# Altium project SN74LVC2T45.PrjPcb
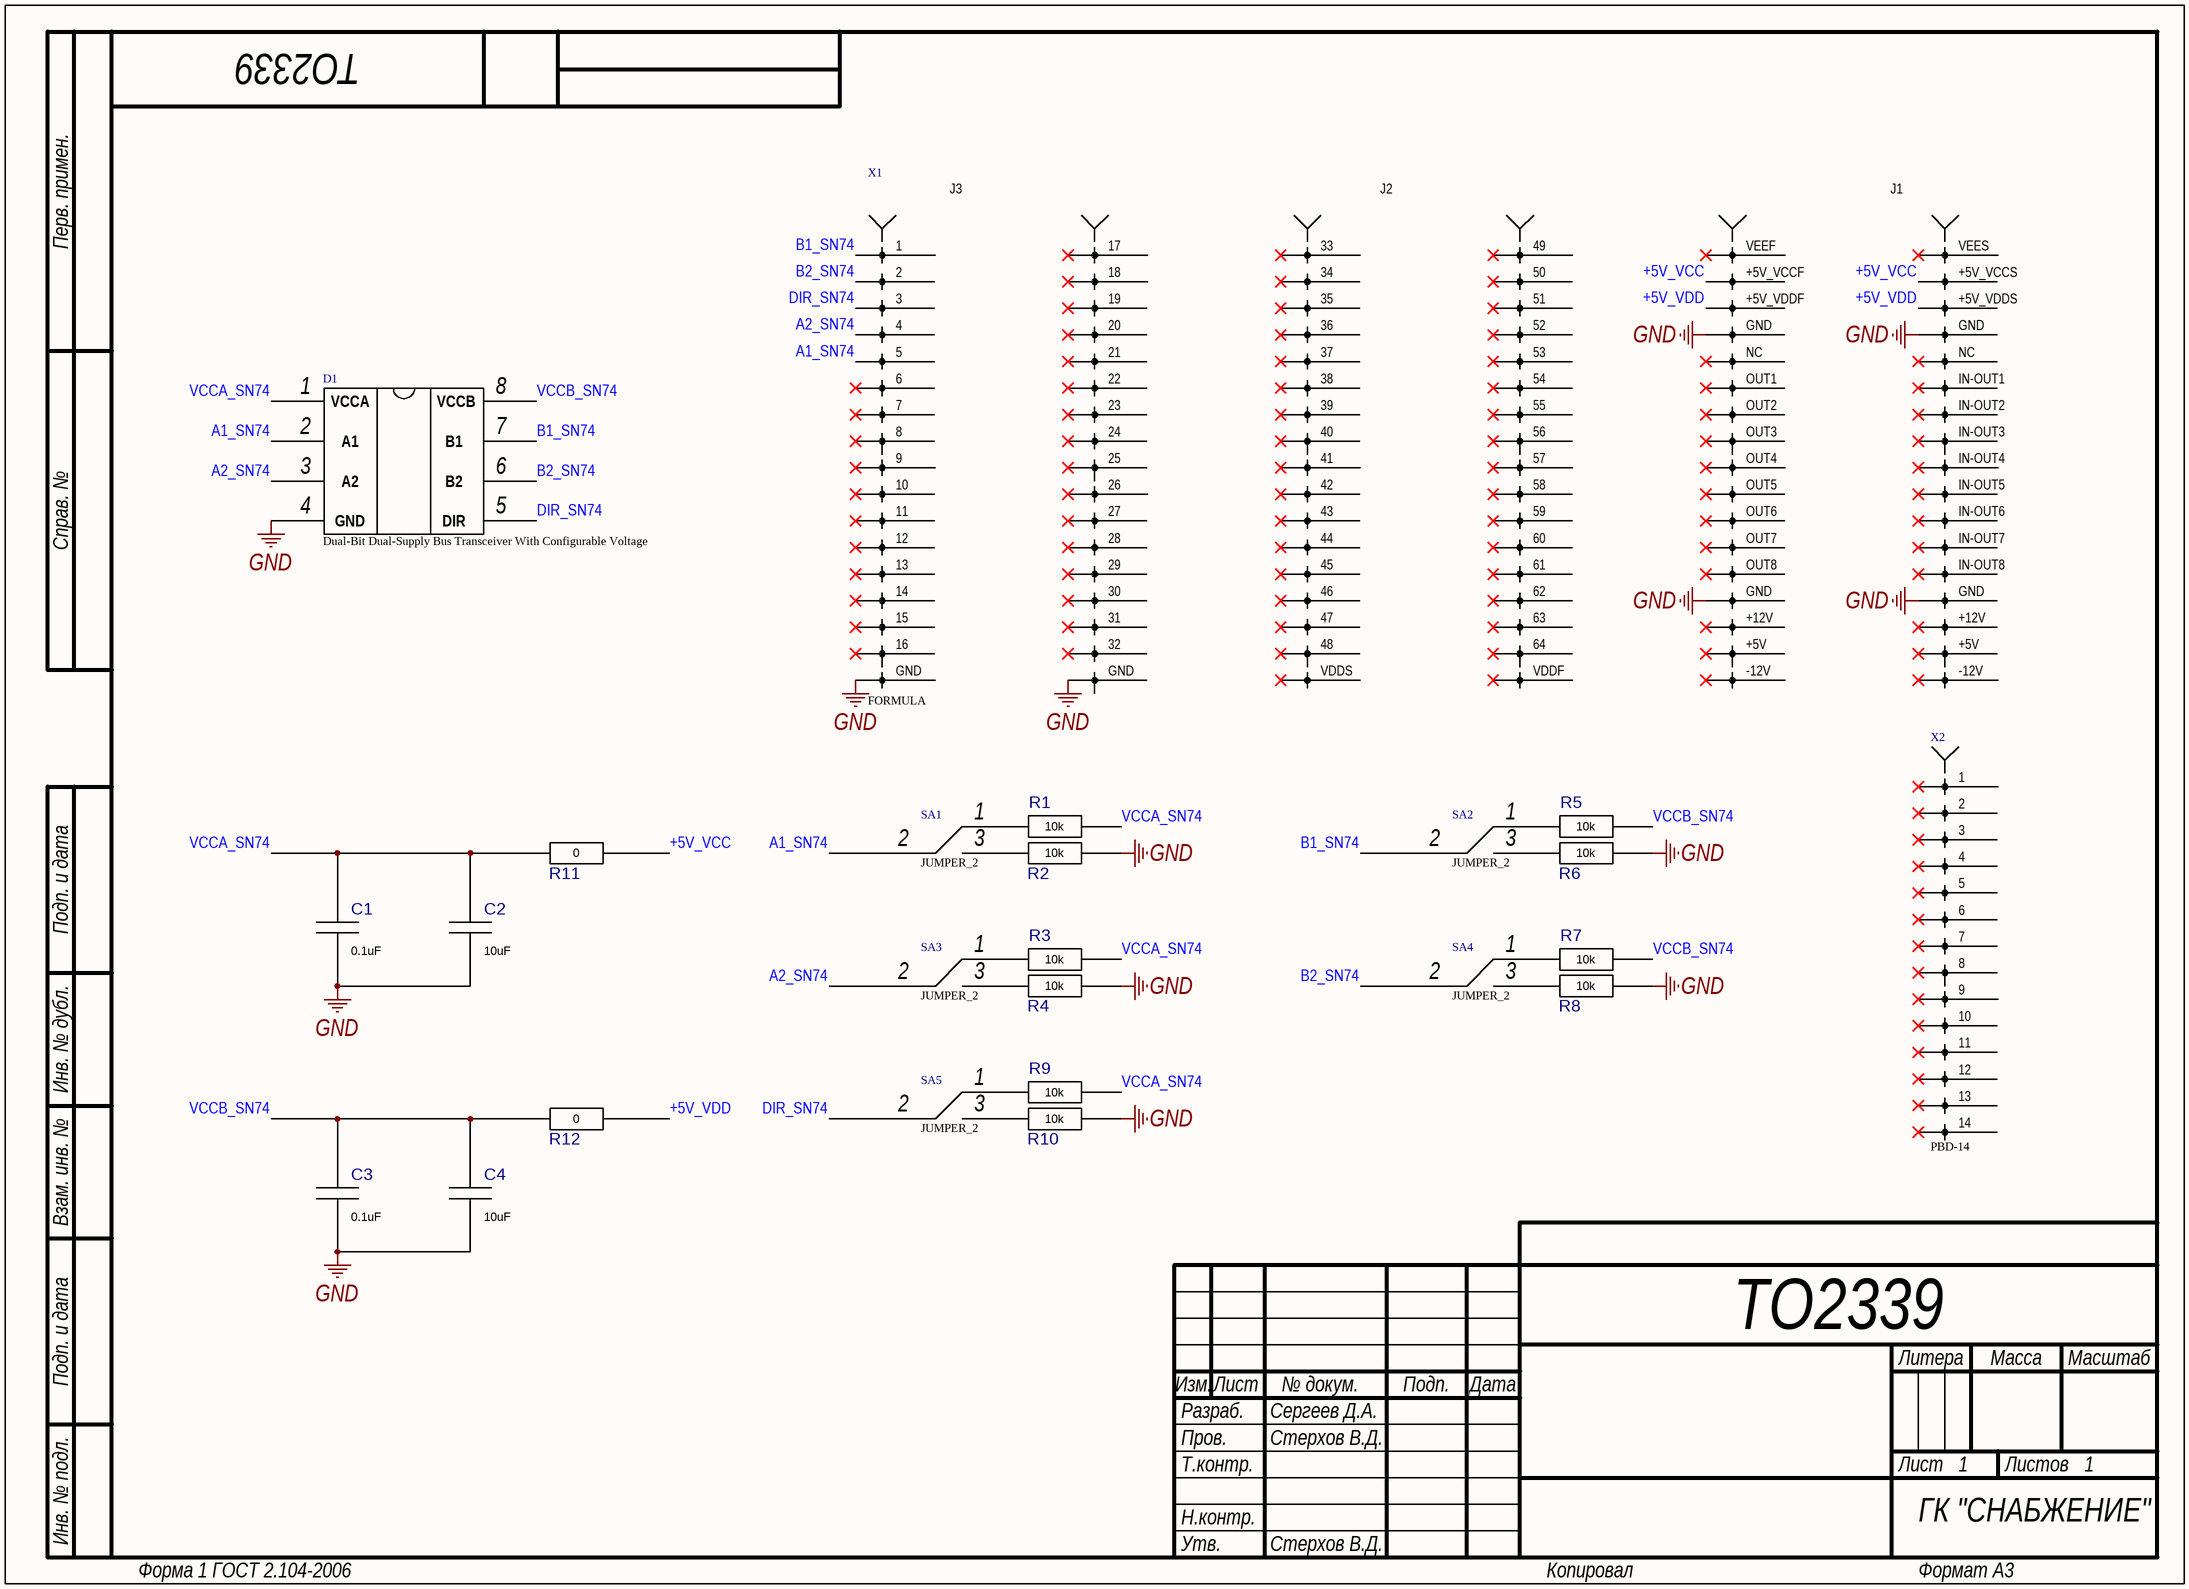
[diagram p0: Sheet1.SchDoc]
1 sheet, 24 parts. Net scope: global (net labels, ports and power ports of the same name join across sheets).
Board file: PCB1.PcbDoc

## Sheet Sheet1.SchDoc: ТО2339
size 410 x 297 mm; ApprovedBy: Стерхов В.Д.; CheckedBy: Стерхов В.Д.; Author: Сергеев Д.А.; CompanyName: ГК "СНАБЖЕНИЕ"; DrawnBy: Сергеев Д.А.; Engineer: Сергеев Д.А.; Organization: ГК "СНАБЖЕНИЕ"; DocumentNumber: ТО2339; Revision: 1; SheetNumber: 1; SheetTotal: 1

### Parts
C1  0.1uF  [0805]
C2  10uF  [0805]
C3  0.1uF  [0805]
C4  10uF  [0805]
D1  Dual-Bit Dual-Supply Bus Transceiver With Configurable Voltage  [PLS-8-7.62]
R1  10k  [0805]
R2  10k  [0805]
R3  10k  [0805]
R4  10k  [0805]
R5  10k  [0805]
R6  10k  [0805]
R7  10k  [0805]
R8  10k  [0805]
R9  10k  [0805]
R10  10k  [0805]
R11  0  [0805]
R12  0  [0805]
SA1  JUMPER_2  [PLS3-2,54]
SA2  JUMPER_2  [PLS3-2,54]
SA3  JUMPER_2  [PLS3-2,54]
SA4  JUMPER_2  [PLS3-2,54]
SA5  JUMPER_2  [PLS3-2,54]
X1  FORMULA  [FORMULA]
X2  PBD-14  [PBD-14]

### Nets
GND: C1.2 C2.2 C3.2 C4.2 D1.4 R2.2 R4.2 R6.2 R8.2 R10.2 X1.GND
+5V_VCC: R11.2 X1.+5V_VCCF(VCCF) X1.+5V_VCCS(VCCS)
+5V_VDD: R12.2 X1.+5V_VDDF(VDDF) X1.+5V_VDDS(VDDS)
A1_SN74: D1.2 SA1.2 X1.5
A2_SN74: D1.3 SA3.2 X1.4
B1_SN74: D1.7 SA2.2 X1.1
B2_SN74: D1.6 SA4.2 X1.2
DIR_SN74: D1.5 SA5.2 X1.3
VCCA_SN74: C1.1 C2.1 D1.1 R1.2 R3.2 R9.2 R11.1
VCCB_SN74: C3.1 C4.1 D1.8 R5.2 R7.2 R12.1
NetR1_1: R1.1 SA1.1
NetR2_1: R2.1 SA1.3
NetR3_1: R3.1 SA3.1
NetR4_1: R4.1 SA3.3
NetR5_1: R5.1 SA2.1
NetR6_1: R6.1 SA2.3
NetR7_1: R7.1 SA4.1
NetR8_1: R8.1 SA4.3
NetR9_1: R9.1 SA5.1
NetR10_1: R10.1 SA5.3

Not connected (* = marked no-connect by the designer): X1 6* 7* 8* 9* 10* 11* 12* 13* 14* 15* 16* 17* 18* 19* 20* 21* 22* 23* 24* 25* 26* 27* 28* 29* 30* 31* 32* 33* 34* 35* 36(4)* 37(5)* 38* 39* 40* 41* 42* 43* 44* 45* 46* 47* 48* 49* 50* 51* 52* 53* 54* 55* 56* 57* 58* 59* 60* 61* 62* 63* 64* +5V* +12V* -12V* IN-OUT1* IN-OUT2* IN-OUT3* IN-OUT4* IN-OUT5* IN-OUT6* IN-OUT7* IN-OUT8* NC* OUT1* OUT2* OUT3* OUT4* OUT5* OUT6* OUT7* OUT8* VDDF* VDDS* VEEF* VEES*; X2 1* 2* 3* 4* 5* 6* 7* 8* 9* 10* 11* 12* 13* 14*

### Notes on the sheet
- Перв. примен.
- Справ. №
- Подп. и дата
- Инв. № дубл.
- Взам. инв. №
- Разраб.
- Изм.
- Лист
- № докум.
- Подп.
- Дата
- Литера
- Масса
- Масштаб
- Пров.
- Т.контр.
- Листов
- Инв. № подл.
- Н.контр.
- Утв.
- Форма 1 ГОСТ 2.104-2006
- Копировал
- Формат А3

### Library data of the parts
C1-C4 = C0805: ComponentHeigt: 1.3; Firme: AVX; Leadform: SMD; KIND: Конденсатор; ClassName: *; Component Link: *; ComponentWeigt: *; Packaging: 0805; NN: *; Value: *
D1 = SN74LVC2T45
R1-R12 = R0805 Yageo: ComponentHeigt: 0.6; Firme: Yageo; Leadform: SMD; Kind: Резистор; ClassName: *; ComponentWeigt: *; Component Link: *; Packaging: 0805; NN: *; Value: *